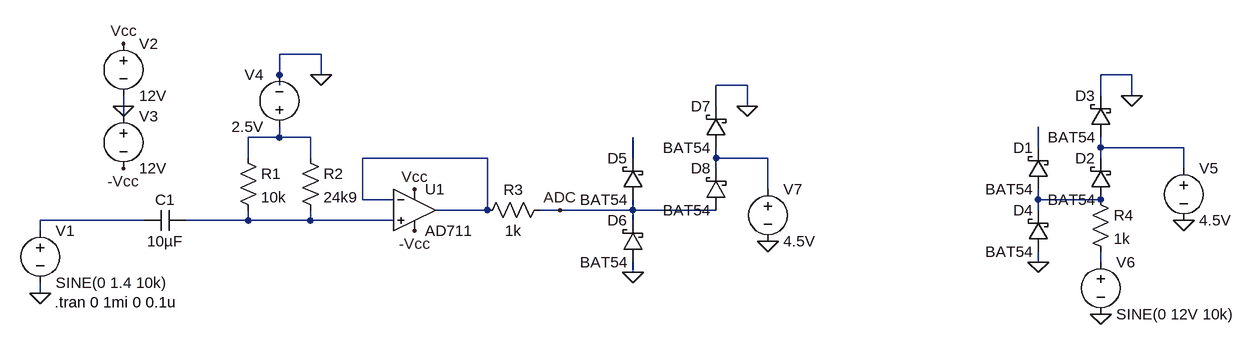
[diagram p0: schematic InputCircuit.asc]
InputCircuit.asc, the LTspice schematic file:
Version 4
SHEET 1 1980 680
WIRE 560 -176 496 -176
WIRE 496 -144 496 -176
WIRE 560 -144 560 -176
WIRE 1808 -144 1760 -144
WIRE 496 -128 496 -144
WIRE 1216 -128 1168 -128
WIRE 1760 -112 1760 -144
WIRE 1808 -112 1808 -144
WIRE 256 -96 256 -112
WIRE 1168 -96 1168 -128
WIRE 1216 -96 1216 -128
WIRE 256 -80 256 -96
WIRE 496 -48 496 -64
WIRE 496 -48 448 -48
WIRE 544 -48 496 -48
WIRE 1664 -32 1664 -64
WIRE 1760 -32 1760 -48
WIRE 1888 -32 1760 -32
WIRE 448 -16 448 -48
WIRE 544 -16 544 -48
WIRE 816 -16 624 -16
WIRE 1040 -16 1040 -48
WIRE 1168 -16 1168 -32
WIRE 1248 -16 1168 -16
WIRE 1760 -16 1760 -32
WIRE 1168 0 1168 -16
WIRE 1888 0 1888 -32
WIRE 1248 32 1248 -16
WIRE 624 48 624 -16
WIRE 672 48 624 48
WIRE 1664 48 1664 32
WIRE 1760 48 1664 48
WIRE 816 64 816 -16
WIRE 816 64 736 64
WIRE 928 64 896 64
WIRE 1040 64 1040 48
WIRE 1040 64 928 64
WIRE 1168 64 1040 64
WIRE 1664 64 1664 48
WIRE 288 80 128 80
WIRE 448 80 448 64
WIRE 448 80 352 80
WIRE 544 80 544 64
WIRE 544 80 448 80
WIRE 672 80 544 80
WIRE 1040 80 1040 64
WIRE 128 96 128 80
WIRE 1664 144 1664 128
WIRE 1760 144 1760 128
WIRE 1040 160 1040 144
WIRE 128 192 128 176
FLAG 256 -96 0
FLAG 256 -192 Vcc
FLAG 256 0 -Vcc
FLAG 560 -144 0
FLAG 704 32 Vcc
FLAG 704 96 -Vcc
FLAG 1888 80 0
FLAG 128 192 0
FLAG 1760 224 0
FLAG 1808 -112 0
FLAG 1664 144 0
FLAG 1040 160 0
FLAG 928 64 ADC
FLAG 1216 -96 0
FLAG 1248 112 0
SYMBOL voltage 128 80 R0
WINDOW 123 24 124 Left 2
WINDOW 39 0 0 Left 0
SYMATTR InstName V1
SYMATTR Value SINE(0 1.4 10k)
SYMBOL voltage 256 -208 R0
WINDOW 123 0 0 Left 0
WINDOW 39 0 0 Left 0
SYMATTR InstName V2
SYMATTR Value 12V
SYMBOL voltage 256 -96 R0
WINDOW 123 0 0 Left 0
WINDOW 39 0 0 Left 0
SYMATTR InstName V3
SYMATTR Value 12V
SYMBOL cap 352 64 R90
WINDOW 0 0 32 VBottom 2
WINDOW 3 32 32 VTop 2
SYMATTR InstName C1
SYMATTR Value 10µF
SYMBOL res 432 -32 R0
SYMATTR InstName R1
SYMATTR Value 10k
SYMBOL res 528 -32 R0
SYMATTR InstName R2
SYMATTR Value 24k9
SYMBOL voltage 496 -48 R180
WINDOW 0 24 96 Left 2
WINDOW 3 24 16 Left 2
WINDOW 123 0 0 Left 0
WINDOW 39 0 0 Left 0
SYMATTR InstName V4
SYMATTR Value 2.5V
SYMBOL OpAmps\\AD711 704 0 R0
SYMATTR InstName U1
SYMBOL voltage 1888 -16 R0
WINDOW 123 0 0 Left 0
WINDOW 39 0 0 Left 0
SYMATTR InstName V5
SYMATTR Value 4.5V
SYMBOL res 912 48 R90
WINDOW 0 0 56 VBottom 2
WINDOW 3 32 56 VTop 2
SYMATTR InstName R3
SYMATTR Value 1k
SYMBOL schottky 1776 -48 R180
WINDOW 0 24 64 Left 2
WINDOW 3 24 0 Left 2
SYMATTR InstName D3
SYMATTR Value BAT54
SYMATTR Description Diode
SYMATTR Type diode
SYMBOL voltage 1760 128 R0
WINDOW 123 0 0 Left 0
WINDOW 39 0 0 Left 0
SYMATTR InstName V6
SYMATTR Value SINE(0 12V 10k)
SYMBOL res 1744 32 R0
SYMATTR InstName R4
SYMATTR Value 1k
SYMBOL schottky 1776 48 R180
WINDOW 0 24 64 Left 2
WINDOW 3 24 0 Left 2
SYMATTR InstName D2
SYMATTR Value BAT54
SYMATTR Description Diode
SYMATTR Type diode
SYMBOL schottky 1680 32 R180
WINDOW 0 24 64 Left 2
WINDOW 3 24 0 Left 2
SYMATTR InstName D1
SYMATTR Value BAT54
SYMATTR Description Diode
SYMATTR Type diode
SYMBOL schottky 1680 128 R180
WINDOW 0 24 64 Left 2
WINDOW 3 24 0 Left 2
SYMATTR InstName D4
SYMATTR Value BAT54
SYMATTR Description Diode
SYMATTR Type diode
SYMBOL schottky 1056 48 R180
WINDOW 0 24 64 Left 2
WINDOW 3 24 0 Left 2
SYMATTR InstName D5
SYMATTR Value BAT54
SYMATTR Description Diode
SYMATTR Type diode
SYMBOL schottky 1056 144 R180
WINDOW 0 24 64 Left 2
WINDOW 3 24 0 Left 2
SYMATTR InstName D6
SYMATTR Value BAT54
SYMATTR Description Diode
SYMATTR Type diode
SYMBOL schottky 1184 -32 R180
WINDOW 0 24 64 Left 2
WINDOW 3 24 0 Left 2
SYMATTR InstName D7
SYMATTR Value BAT54
SYMATTR Description Diode
SYMATTR Type diode
SYMBOL schottky 1184 64 R180
WINDOW 0 24 64 Left 2
WINDOW 3 24 0 Left 2
SYMATTR InstName D8
SYMATTR Value BAT54
SYMATTR Description Diode
SYMATTR Type diode
SYMBOL voltage 1248 16 R0
WINDOW 123 0 0 Left 0
WINDOW 39 0 0 Left 0
SYMATTR InstName V7
SYMATTR Value 4.5V
TEXT 150 206 Left 2 !.tran 0 1mi 0 0.1u

The netlist it stands for:
* InputCircuit.asc
V1 N008 0 SINE(0 1.4 10k)
V2 Vcc 0 12V
V3 0 -Vcc 12V
C1 N009 N008 10µF
R1 N001 N009 10k
R2 N001 N009 24k9
V4 N001 0 2.5V
XU1 N009 N004 Vcc -Vcc N004 AD712  ; AD711, pins In+ In- V+ V- OUT
V5 N003 0 4.5V
R3 ADC N004 1k
D3 N003 0 BAT54
V6 N010 0 SINE(0 12V 10k)
R4 N007 N010 1k
D2 N007 N003 BAT54
D1 N007 N002 BAT54
D4 0 N007 BAT54
D5 ADC N005 BAT54
D6 0 ADC BAT54
D7 N006 0 BAT54
D8 ADC N006 BAT54
V7 N006 0 4.5V
.model D D
.lib standard.dio
.tran 0 1mi 0 0.1u
.lib ADI1.lib
.backanno
.end